# Altium schematic sheet Controller-Sheet-3.SchDoc
size 420 x 297 mm; SheetNumber: 5; SheetTotal: 15
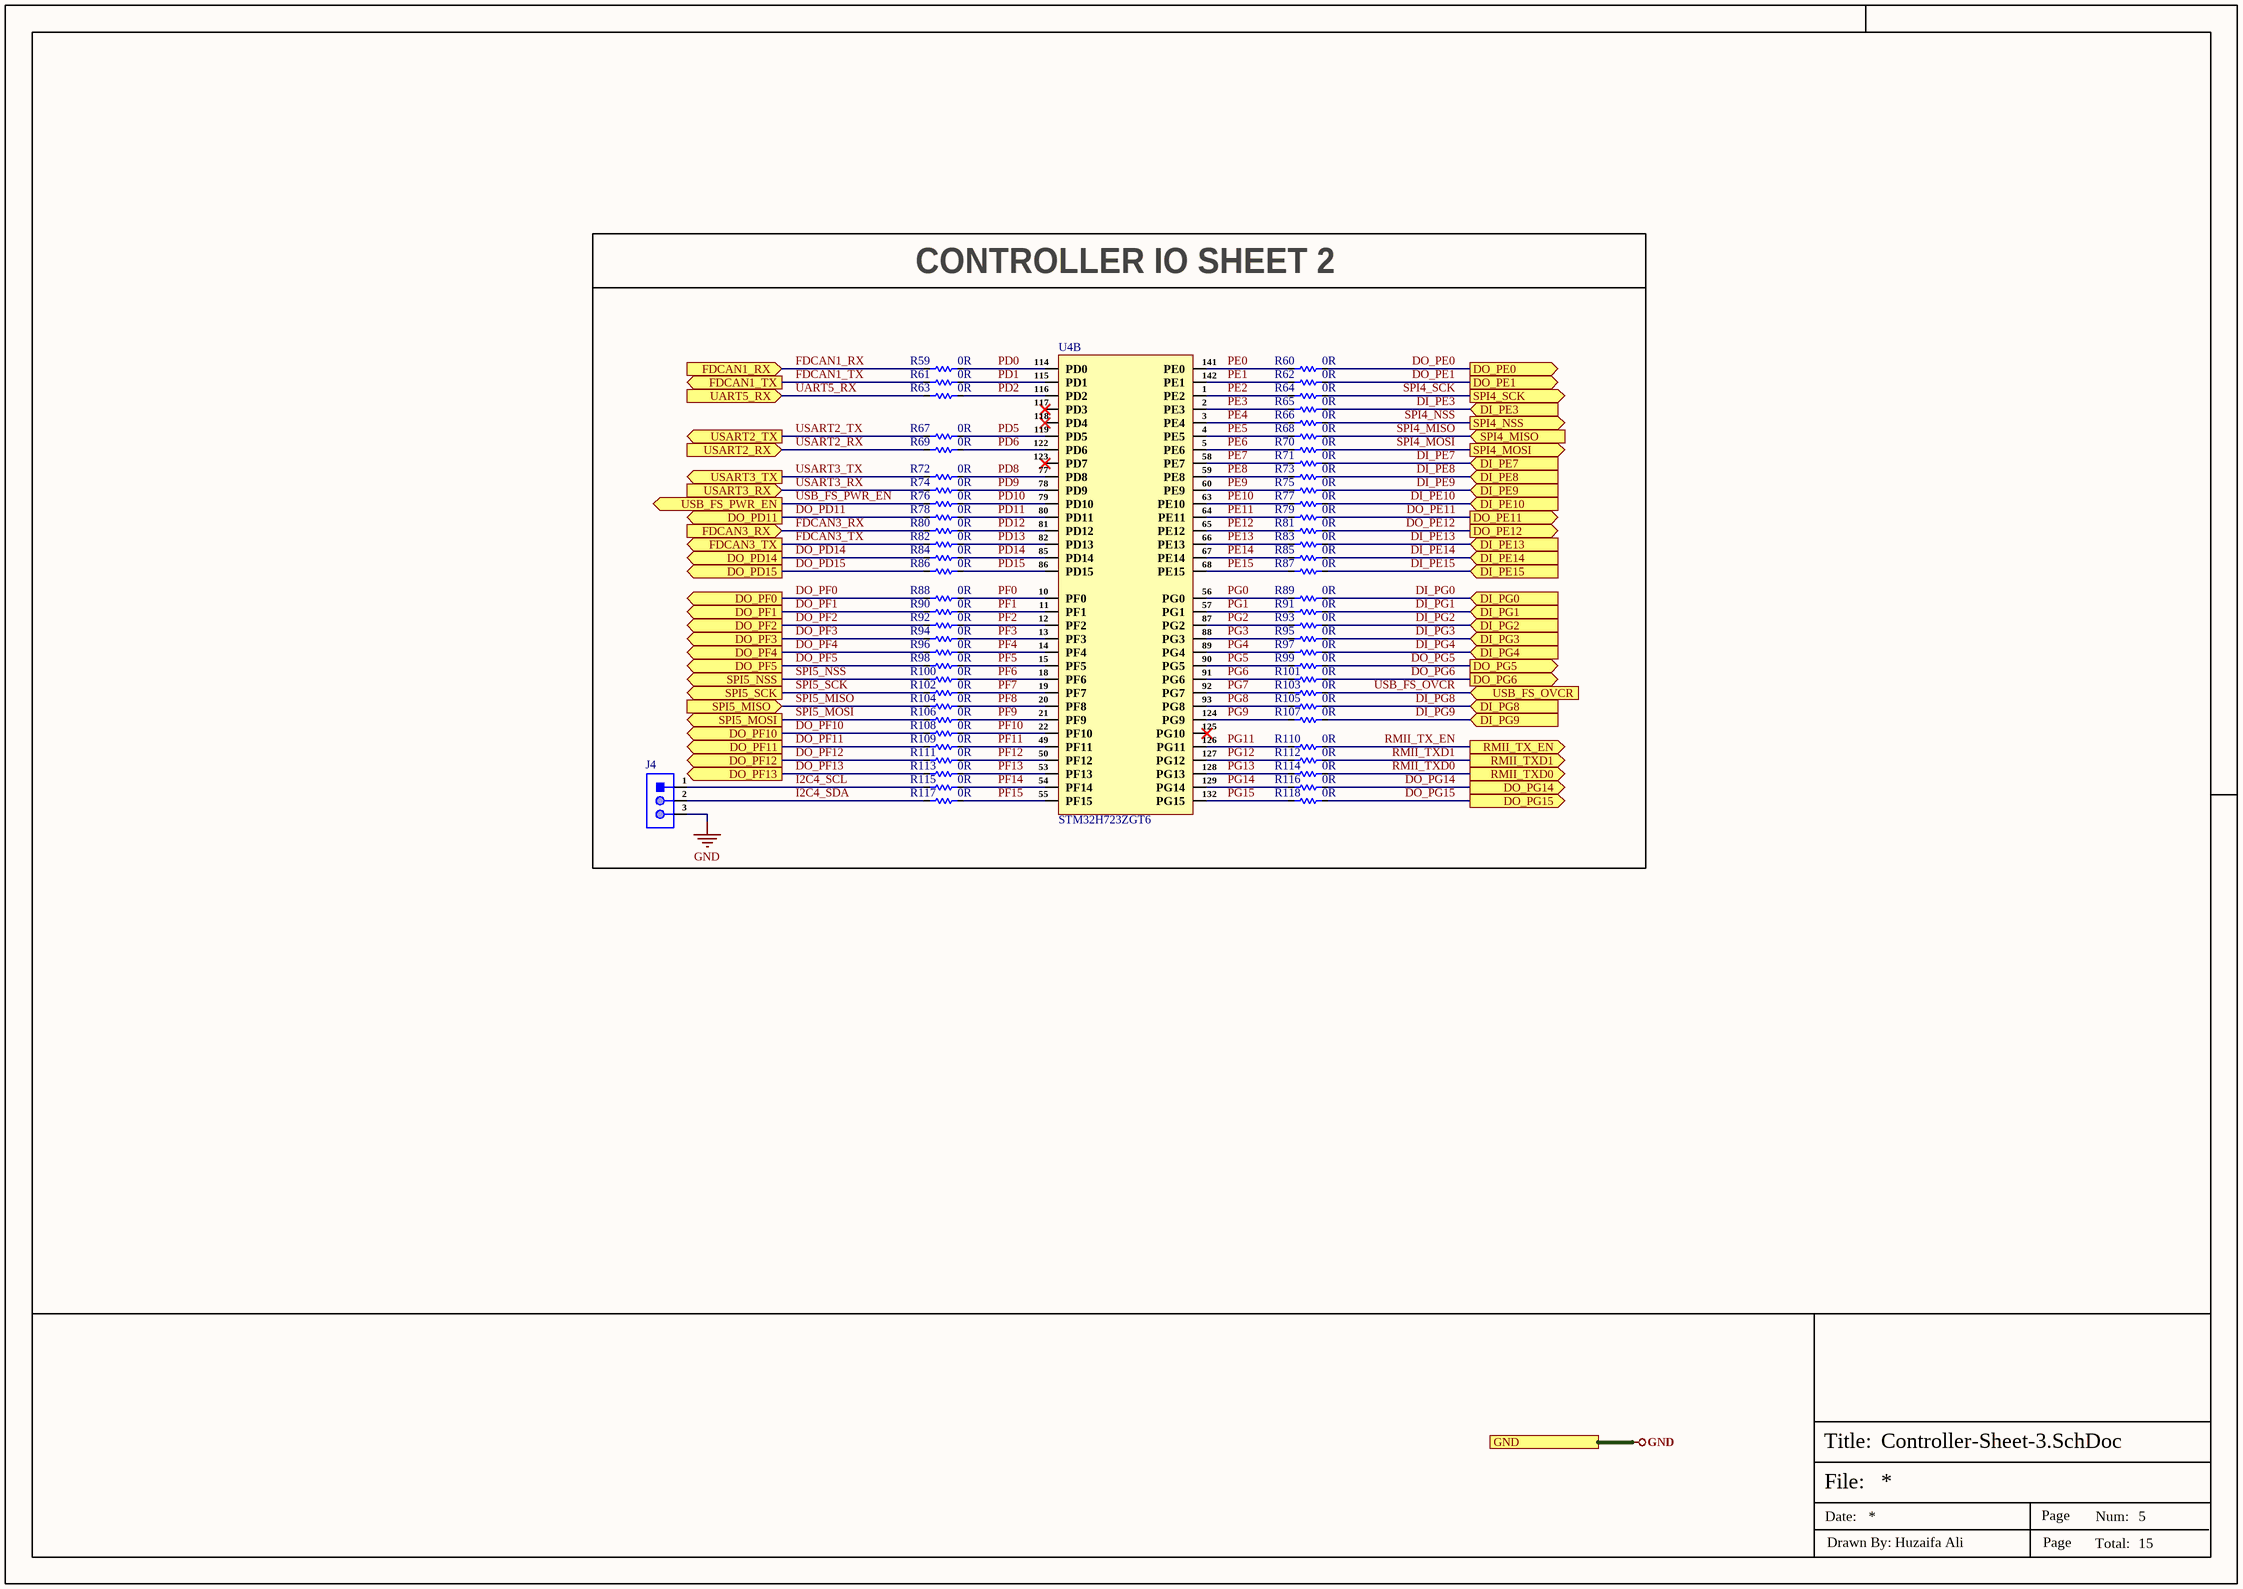
[diagram p0: Controller-Sheet-3.SchDoc]

## Parts
J4  X6511WV-03H-C60D30  [HDR1X3_]  (value not drawn)
R59  0R  [Res-0402]
R60  0R  [Res-0402]
R61  0R  [Res-0402]
R62  0R  [Res-0402]
R63  0R  [Res-0402]
R64  0R  [Res-0402]
R65  0R  [Res-0402]
R66  0R  [Res-0402]
R67  0R  [Res-0402]
R68  0R  [Res-0402]
R69  0R  [Res-0402]
R70  0R  [Res-0402]
R71  0R  [Res-0402]
R72  0R  [Res-0402]
R73  0R  [Res-0402]
R74  0R  [Res-0402]
R75  0R  [Res-0402]
R76  0R  [Res-0402]
R77  0R  [Res-0402]
R78  0R  [Res-0402]
R79  0R  [Res-0402]
R80  0R  [Res-0402]
R81  0R  [Res-0402]
R82  0R  [Res-0402]
R83  0R  [Res-0402]
R84  0R  [Res-0402]
R85  0R  [Res-0402]
R86  0R  [Res-0402]
R87  0R  [Res-0402]
R88  0R  [Res-0402]
R89  0R  [Res-0402]
R90  0R  [Res-0402]
R91  0R  [Res-0402]
R92  0R  [Res-0402]
R93  0R  [Res-0402]
R94  0R  [Res-0402]
R95  0R  [Res-0402]
R96  0R  [Res-0402]
R97  0R  [Res-0402]
R98  0R  [Res-0402]
R99  0R  [Res-0402]
R100  0R  [Res-0402]
R101  0R  [Res-0402]
R102  0R  [Res-0402]
R103  0R  [Res-0402]
R104  0R  [Res-0402]
R105  0R  [Res-0402]
R106  0R  [Res-0402]
R107  0R  [Res-0402]
R108  0R  [Res-0402]
R109  0R  [Res-0402]
R110  0R  [Res-0402]
R111  0R  [Res-0402]
R112  0R  [Res-0402]
R113  0R  [Res-0402]
R114  0R  [Res-0402]
R115  0R  [Res-0402]
R116  0R  [Res-0402]
R117  0R  [Res-0402]
R118  0R  [Res-0402]
U4  STM32H723ZGT6  [LQFP-144(20x20)]  (part B of 3)

## Blocks framed on the sheet
CONTROLLER IO SHEET 2: J4 R59-R118 U4

## Ports
DI_PE3 (in, see Top-Sheet[3D]), DI_PE7 (in, see Top-Sheet[4C]), DI_PE8 (in, see Top-Sheet[4C]), DI_PE9 (in, see Top-Sheet[4C]), DI_PE10 (in, see Top-Sheet[4C]), DI_PE13 (in, see Top-Sheet[4C]), DI_PE14 (in, see Top-Sheet[4C]), DI_PE15 (in, see Top-Sheet[4C]), DI_PG0 (in, see Top-Sheet[4C]), DI_PG1 (in, see Top-Sheet[4C]), DI_PG2 (in, see Top-Sheet[4C]), DI_PG3 (in, see Top-Sheet[4C]), DI_PG4 (in, see Top-Sheet[4C]), DI_PG8 (in, see Top-Sheet[4B]), DI_PG9 (in, see Top-Sheet[4B]), DO_PD11 (out, see Top-Sheet[4C]), DO_PD14 (out, see Top-Sheet[4C]), DO_PD15 (out, see Top-Sheet[4C]), DO_PE0 (out, see Top-Sheet[4C]), DO_PE1 (out, see Top-Sheet[4C]), DO_PE11 (out, see Top-Sheet[4C]), DO_PE12 (out, see Top-Sheet[4C]), DO_PF0 (out, see Top-Sheet[3B]), DO_PF1 (out, see Top-Sheet[3B]), DO_PF2 (out, see Top-Sheet[3C]), DO_PF3 (out, see Top-Sheet[3C]), DO_PF4 (out, see Top-Sheet[3C]), DO_PF5 (out, see Top-Sheet[3C]), DO_PF10 (out, see Top-Sheet[3C]), DO_PF11 (out, see Top-Sheet[3C]), DO_PF12 (out, see Top-Sheet[3C]), DO_PF13 (out, see Top-Sheet[4C]), DO_PG5 (out, see Top-Sheet[4D]), DO_PG6 (out, see Top-Sheet[4D]), DO_PG14 (out, see Top-Sheet[4B]), DO_PG15 (out, see Top-Sheet[4B]), FDCAN1_RX (in, see Top-Sheet[3C]), FDCAN1_TX (out, see Top-Sheet[3B]), FDCAN3_RX (in, see Top-Sheet[3C]), FDCAN3_TX (out, see Top-Sheet[3C]), GND (see Top-Sheet[3B], Buttons-Lights-Sensors-Sheet[4D], CAN-Sheet[6D], Controller-Sheet-1[4D], Controller-Sheet-2[4D], EtherCAT-Sheet[1D], Ethernet-PHY-Sheet[4D], Extra-DIOs[4D], Power-Sheet[4D], RS232-Sheet[5D], RS485-Sheet[5D], USB-Sheet[4D], VFD-Support-Sheet2[4D], VFD-Support-Sheet[4D]), RMII_TX_EN (out, see Top-Sheet[3B]), RMII_TXD0 (out, see Top-Sheet[3B]), RMII_TXD1 (out, see Top-Sheet[3B]), SPI4_MISO (in, see Top-Sheet[3D]), SPI4_MOSI (out, see Top-Sheet[3D]), SPI4_NSS (out, see Top-Sheet[3D]), SPI4_SCK (out, see Top-Sheet[3D]), SPI5_MISO (in, see Top-Sheet[3D]), SPI5_MOSI (out, see Top-Sheet[3D]), SPI5_NSS (out, see Top-Sheet[3D]), SPI5_SCK (out, see Top-Sheet[3D]), UART5_RX (in, see Top-Sheet[3C]), USART2_RX (in, see Top-Sheet[4B]), USART2_TX (out, see Top-Sheet[4B]), USART3_RX (in, see Top-Sheet[3C]), USART3_TX (out, see Top-Sheet[3C]), USB_FS_OVCR (in, see Top-Sheet[4B], USB-Sheet[1D]), USB_FS_PWR_EN (out, see Top-Sheet[4C], USB-Sheet[1D])

## Nets
GND: J4.3 ; port GND
DI_PE3: R65.1 ; port DI_PE3
DI_PE7: R71.1 ; port DI_PE7
DI_PE8: R73.1 ; port DI_PE8
DI_PE9: R75.1 ; port DI_PE9
DI_PE10: R77.1 ; port DI_PE10
DI_PE13: R83.1 ; port DI_PE13
DI_PE14: R85.1 ; port DI_PE14
DI_PE15: R87.1 ; port DI_PE15
DI_PG0: R89.1 ; port DI_PG0
DI_PG1: R91.1 ; port DI_PG1
DI_PG2: R93.1 ; port DI_PG2
DI_PG3: R95.1 ; port DI_PG3
DI_PG4: R97.1 ; port DI_PG4
DI_PG8: R105.1 ; port DI_PG8
DI_PG9: R107.1 ; port DI_PG9
DO_PD11: R78.2 ; port DO_PD11
DO_PD14: R84.2 ; port DO_PD14
DO_PD15: R86.2 ; port DO_PD15
DO_PE0: R60.1 ; port DO_PE0
DO_PE1: R62.1 ; port DO_PE1
DO_PE11: R79.1 ; port DO_PE11
DO_PE12: R81.1 ; port DO_PE12
DO_PF0: R88.2 ; port DO_PF0
DO_PF1: R90.2 ; port DO_PF1
DO_PF2: R92.2 ; port DO_PF2
DO_PF3: R94.2 ; port DO_PF3
DO_PF4: R96.2 ; port DO_PF4
DO_PF5: R98.2 ; port DO_PF5
DO_PF10: R108.2 ; port DO_PF10
DO_PF11: R109.2 ; port DO_PF11
DO_PF12: R111.2 ; port DO_PF12
DO_PF13: R113.2 ; port DO_PF13
DO_PG5: R99.1 ; port DO_PG5
DO_PG6: R101.1 ; port DO_PG6
DO_PG14: R116.1 ; port DO_PG14
DO_PG15: R118.1 ; port DO_PG15
FDCAN1_RX: R59.2 ; port FDCAN1_RX
FDCAN1_TX: R61.2 ; port FDCAN1_TX
FDCAN3_RX: R80.2 ; port FDCAN3_RX
FDCAN3_TX: R82.2 ; port FDCAN3_TX
I2C4_SCL: J4.1 R115.2
I2C4_SDA: J4.2 R117.2
PD0: R59.1 U4.114(PD0)
PD1: R61.1 U4.115(PD1)
PD2: R63.1 U4.116(PD2)
PD5: R67.1 U4.119(PD5)
PD6: R69.1 U4.122(PD6)
PD8: R72.1 U4.77(PD8)
PD9: R74.1 U4.78(PD9)
PD10: R76.1 U4.79(PD10)
PD11: R78.1 U4.80(PD11)
PD12: R80.1 U4.81(PD12)
PD13: R82.1 U4.82(PD13)
PD14: R84.1 U4.85(PD14)
PD15: R86.1 U4.86(PD15)
PE0: R60.2 U4.141(PE0)
PE1: R62.2 U4.142(PE1)
PE2: R64.2 U4.1(PE2)
PE3: R65.2 U4.2(PE3)
PE4: R66.2 U4.3(PE4)
PE5: R68.2 U4.4(PE5)
PE6: R70.2 U4.5(PE6)
PE7: R71.2 U4.58(PE7)
PE8: R73.2 U4.59(PE8)
PE9: R75.2 U4.60(PE9)
PE10: R77.2 U4.63(PE10)
PE11: R79.2 U4.64(PE11)
PE12: R81.2 U4.65(PE12)
PE13: R83.2 U4.66(PE13)
PE14: R85.2 U4.67(PE14)
PE15: R87.2 U4.68(PE15)
PF0: R88.1 U4.10(PF0)
PF1: R90.1 U4.11(PF1)
PF2: R92.1 U4.12(PF2)
PF3: R94.1 U4.13(PF3)
PF4: R96.1 U4.14(PF4)
PF5: R98.1 U4.15(PF5)
PF6: R100.1 U4.18(PF6)
PF7: R102.1 U4.19(PF7)
PF8: R104.1 U4.20(PF8)
PF9: R106.1 U4.21(PF9)
PF10: R108.1 U4.22(PF10)
PF11: R109.1 U4.49(PF11)
PF12: R111.1 U4.50(PF12)
PF13: R113.1 U4.53(PF13)
PF14: R115.1 U4.54(PF14)
PF15: R117.1 U4.55(PF15)
PG0: R89.2 U4.56(PG0)
PG1: R91.2 U4.57(PG1)
PG2: R93.2 U4.87(PG2)
PG3: R95.2 U4.88(PG3)
PG4: R97.2 U4.89(PG4)
PG5: R99.2 U4.90(PG5)
PG6: R101.2 U4.91(PG6)
PG7: R103.2 U4.92(PG7)
PG8: R105.2 U4.93(PG8)
PG9: R107.2 U4.124(PG9)
PG11: R110.2 U4.126(PG11)
PG12: R112.2 U4.127(PG12)
PG13: R114.2 U4.128(PG13)
PG14: R116.2 U4.129(PG14)
PG15: R118.2 U4.132(PG15)
RMII_TX_EN: R110.1 ; port RMII_TX_EN
RMII_TXD0: R114.1 ; port RMII_TXD0
RMII_TXD1: R112.1 ; port RMII_TXD1
SPI4_MISO: R68.1 ; port SPI4_MISO
SPI4_MOSI: R70.1 ; port SPI4_MOSI
SPI4_NSS: R66.1 ; port SPI4_NSS
SPI4_SCK: R64.1 ; port SPI4_SCK
SPI5_MISO: R104.2 ; port SPI5_MISO
SPI5_MOSI: R106.2 ; port SPI5_MOSI
SPI5_NSS: R100.2 ; port SPI5_NSS
SPI5_SCK: R102.2 ; port SPI5_SCK
UART5_RX: R63.2 ; port UART5_RX
USART2_RX: R69.2 ; port USART2_RX
USART2_TX: R67.2 ; port USART2_TX
USART3_RX: R74.2 ; port USART3_RX
USART3_TX: R72.2 ; port USART3_TX
USB_FS_OVCR: R103.1 ; port USB_FS_OVCR
USB_FS_PWR_EN: R76.2 ; port USB_FS_PWR_EN

Not connected (* = marked no-connect by the designer): U4 117(PD3)* 118(PD4)* 123(PD7)* 125(PG10)*

## Notes on the sheet
- File:
- Title:
- Date:
- Page
- Num:
- Total:
- Drawn By: Huzaifa Ali

## Library data of the parts
J4 = X6511WV-03H-C60D30: Gold 250V 3A Straight Square Pins 2.5mm 3P 260℃ 6mm -40℃~+105℃ 3mm 2.54mm Plugin Black Brass 1x3P Plugin,P=2.54mm Pin Headers ROHS; Manufacturer: XKB; Item Type: Male Header; Manufacturer Part Number: X6511WV-03H-C60D30; Package: Plugin,P=2.54mm; LCSC Part Number: C706875; ComponentLink1Description: LCSC; ComponentLink1URL: https://www.lcsc.com/product-detail/Pin-Headers_XKB-Connectivity-X6511WV-03H-C60D30_C706875.html
R59-R118 = RC0402FR-070RL: RES 0 OHM JUMPER 1/16W 0402; Manufacturer: Yageo; Item Type: Resistors; Tolerance: 1%; Power Rating: 62.5mW; Voltage Rating: 50V; Temperature Coefficient: 200ppm/°C; Max Power Dissipation: 63mW; Supplier 1: Mouser; Manufacturer Part Number: RC0402FR-070RL; RoHS: Yes; Stock 1: 8556842; Pricing 1: 1=0.10000, 10=0.01400, 50=0.01400, 100=0.00600, 1000=0.00300, 5000=0.00200, 10000=0.00100 (USD); Mount: Surface Mount; Case/Package: 0402; Contact Plating: Tin,Matte; Case Code (Imperial): 0402; Case Code (Metric): 1005; Size Code: 0402; Min Operating Temperature: -55°C; Max Operating Temperature: 155°C; Resistance: 0R; Resistor Type: Thick Film; Packaging: Tape and Reel; Termination: SMD/SMT; Features: Moisture Resistant; Series: RC; Number of Terminations: 2; Length: 1mm; Width: 0.5mm; Height: 0.35mm; Radiation Hardening: No; Lead Free: Lead Free; RoHS Compliant: Yes; ComponentLink1URL: https://datasheet.ciiva.com/8896/pyu-rc0402-51-rohs-l-6-8896149.pdf?src-supplier=Avnet; ComponentLink1Description: https://datasheet.ciiva.com/8896/pyu-rc0402-51-rohs-l-6-8896149.pdf?src-supplier=Avnet; ComponentLink2URL: https://datasheet.ciiva.com/16790/pyu-rc0402-51-rohs-l-6-r-16790444.pdf?src-supplier=Future+Electronics; ComponentLink2Description: https://datasheet.ciiva.com/16790/pyu-rc0402-51-rohs-l-6-r-16790444.pdf?src-supplier=Future+Electronics; Supplier Part Number 1: 603-RC0402FR-070RL; LCSC Part Number: C106231
U4 = STM32H723ZGT6: IC MCU 32BIT 1MB FLASH 144LQFP; Manufacturer: STMicroelectronics; Interface: 39,40,224,1514,1515,1518,1532,1533Interface; Memory Format: 4498,11064MemoryType; Data Bus Width: 32b; Frequency: 550MHz; Max Supply Voltage: 3.6V; Min Supply Voltage: 1.62V; Nominal Supply Current: 4uA; Number of A/D Converters: 1NUMBER; Number of ADC Channels: 16NUMBER; Number of I2C Channels: 5NUMBER; Number of I/Os: 112NUMBER; Number of SPI Channels: 6NUMBER; Number of Timers/Counters: 4NUMBER; RAM Size: 564KB; Supplier: Future Electronics; LCSC Part Number: C730146; Manufacturer Part Number: STM32H723ZGT6; RoHS: No; Item Type: IC; Stock: 4380; Pricing: 60=7.31, 120=7.27, 180=7.25, 240=7.23, 300=7.18 (USD); Min Operating Temperature: -40°C; Max Operating Temperature: 85°C; Density: 1MB; Memory Size: 1MB; Number of Ethernet Channels: 1NUMBER; Number of UART Channels: 6NUMBER; Number of USB Channels: 1NUMBER; Height: 1.6mm